# Altium schematic sheet RV1126_POWER_SHEET.SchDoc
size A4; SheetNumber: 9; SheetTotal: 25
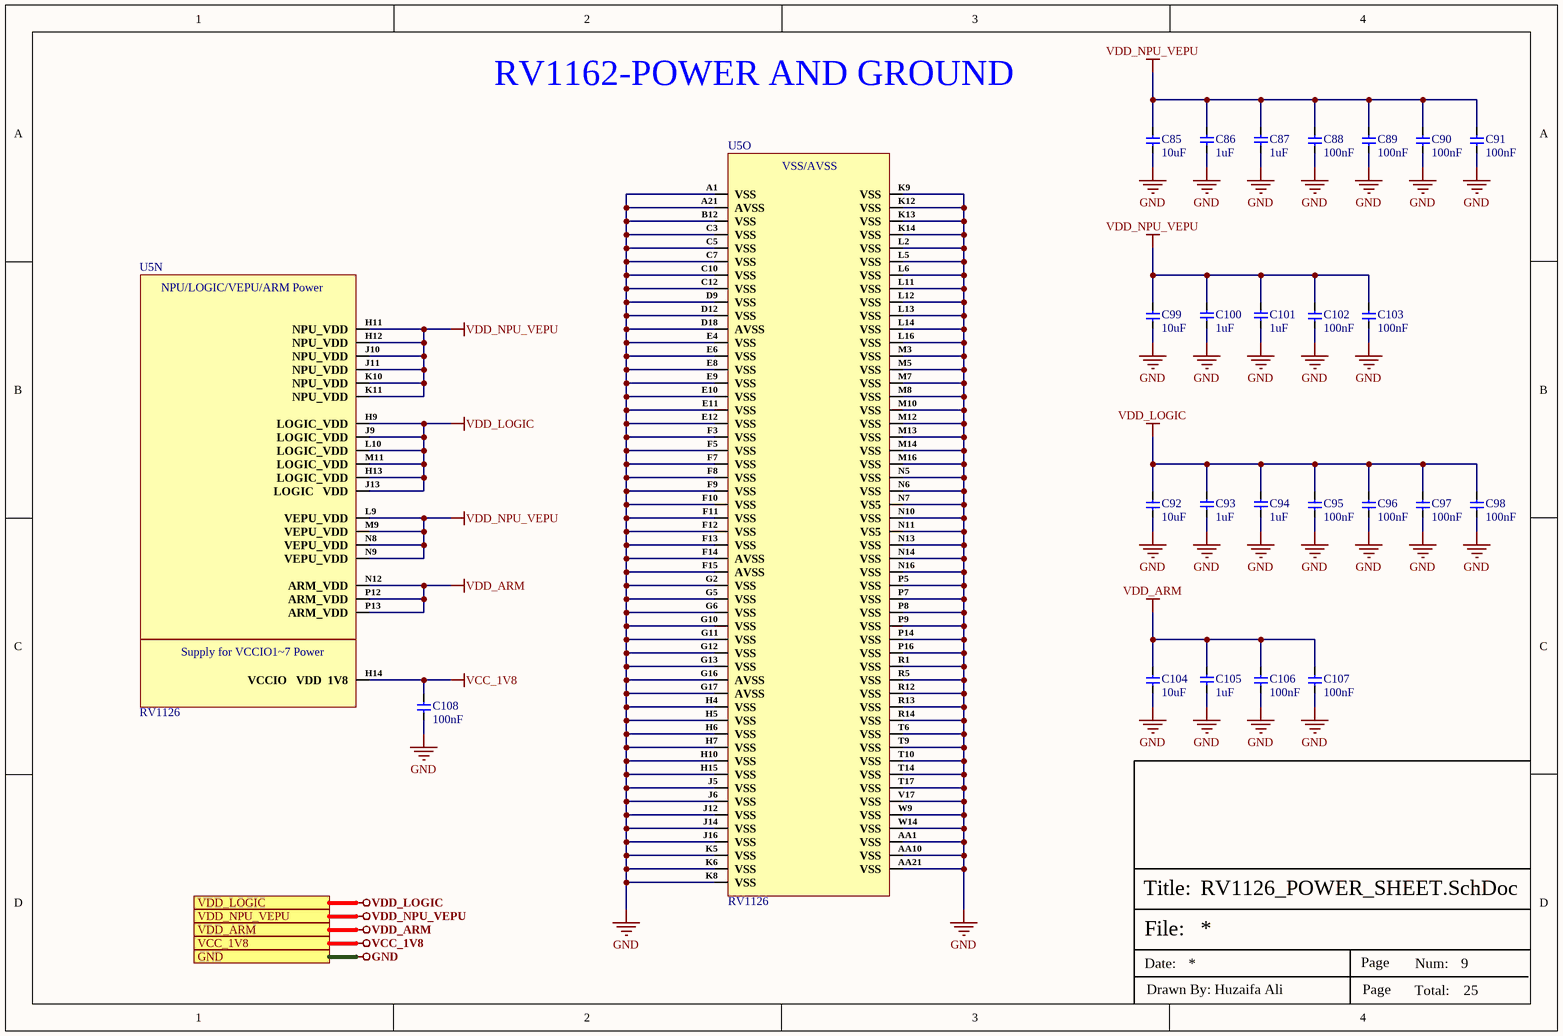
[diagram p0: RV1126_POWER_SHEET.SchDoc]

## Parts
C85  10uF  [Cap-0603]
C86  1uF  [Cap-0402]
C87  1uF  [Cap-0402]
C88  100nF  [CAP-0201]
C89  100nF  [CAP-0201]
C90  100nF  [CAP-0201]
C91  100nF  [CAP-0201]
C92  10uF  [Cap-0603]
C93  1uF  [Cap-0402]
C94  1uF  [Cap-0402]
C95  100nF  [CAP-0201]
C96  100nF  [CAP-0201]
C97  100nF  [CAP-0201]
C98  100nF  [CAP-0201]
C99  10uF  [Cap-0603]
C100  1uF  [Cap-0402]
C101  1uF  [Cap-0402]
C102  100nF  [CAP-0201]
C103  100nF  [CAP-0201]
C104  10uF  [Cap-0603]
C105  1uF  [Cap-0402]
C106  100nF  [CAP-0201]
C107  100nF  [CAP-0201]
C108  100nF  [CAP-0201]
U5  RV1126  [FCCSP-409(14x14)]  (parts N,O of 15)

## Ports
GND (see DDR3_SDRAM_INTERFACE[4D], DIGITAL_MEMS_MIC_INTERFACE[3D], eMMC_INTERFACE[3D], ETHERNET_SWITCH_INTERFACE[5C], IR-CUT_LIGHT SENSOR_SHEET[3D], MIPI TO HDMI_MODULE_INTERFACE[3D], MIPI-CSI_RXX_INTERFACE[4C], PoE PD INTERFACE[3D], PoE_PSE_CONTROLLER[5D], POWER_LDO_SHEET[3D], POWER_PMIC_RK809_CODEC[3D], POWER_PMIC_RK809_DC DC[3D], POWER_PMIC_RK809_LDO[4C], POWER_PMIC_RK809_MANAGEMENT[3D], RV1126_AUDIO_SHEET[3D], RV1126_DRAM_SHEET[4C], RV1126_eMMC_SPI-FLASH_SHEET[3D], RV1126_ETHERNET_SHEET[3D], RV1126_OSC-PLL-PMUIO[3C], RV1126_SARADC_SHEET[3C], SPI_FLASH_INTERFACE[3D], SYNCHRONOUS _BUCK_CONTROLLER[3D], USB2.0_DEBUG_UART[3D], WIFI_AP6256_SHEET[4D]), VCC_1V8, VDD_ARM (see POWER_PMIC_RK809_DC DC[3D]), VDD_LOGIC (see POWER_LDO_SHEET[3D]), VDD_NPU_VEPU (see POWER_PMIC_RK809_DC DC[3D])

## Nets
GND: C85.1 C86.2 C87.2 C88.1 C89.1 C90.1 C91.1 C92.1 C93.2 C94.2 C95.1 C96.1 C97.1 C98.1 C99.1 C100.2 C101.2 C102.1 C103.1 C104.1 C105.2 C106.1 C107.1 C108.1 U5.A1(VSS) U5.A21(AVSS) U5.AA1(VSS) U5.AA10(VSS) U5.AA21(VSS) U5.B12(VSS) U5.C3(VSS) U5.C5(VSS) U5.C7(VSS) U5.C10(VSS) U5.C12(VSS) U5.D9(VSS) U5.D12(VSS) U5.D18(AVSS) U5.E4(VSS) U5.E6(VSS) U5.E8(VSS) U5.E9(VSS) U5.E10(VSS) U5.E11(VSS) U5.E12(VSS) U5.F3(VSS) U5.F5(VSS) U5.F7(VSS) U5.F8(VSS) U5.F9(VSS) U5.F10(VSS) U5.F11(VSS) U5.F12(VSS) U5.F13(VSS) U5.F14(AVSS) U5.F15(AVSS) U5.G2(VSS) U5.G5(VSS) U5.G6(VSS) U5.G10(VSS) U5.G11(VSS) U5.G12(VSS) U5.G13(VSS) U5.G16(AVSS) U5.G17(AVSS) U5.H4(VSS) U5.H5(VSS) U5.H6(VSS) U5.H7(VSS) U5.H10(VSS) U5.H15(VSS) U5.J5(VSS) U5.J6(VSS) U5.J12(VSS) U5.J14(VSS) U5.J16(VSS) U5.K5(VSS) U5.K6(VSS) U5.K8(VSS) U5.K9(VSS) U5.K12(VSS) U5.K13(VSS) U5.K14(VSS) U5.L2(VSS) U5.L5(VSS) U5.L6(VSS) U5.L11(VSS) U5.L12(VSS) U5.L13(VSS) U5.L14(VSS) U5.L16(VSS) U5.M3(VSS) U5.M5(VSS) U5.M7(VSS) U5.M8(VSS) U5.M10(VSS) U5.M12(VSS) U5.M13(VSS) U5.M14(VSS) U5.M16(VSS) U5.N5(VSS) U5.N6(VSS) U5.N7(VS5) U5.N10(VSS) U5.N11(VS5) U5.N13(VSS) U5.N14(VSS) U5.N16(VSS) U5.P5(VSS) U5.P7(VSS) U5.P8(VSS) U5.P9(VSS) U5.P14(VSS) U5.P16(VSS) U5.R1(VSS) U5.R5(VSS) U5.R12(VSS) U5.R13(VSS) U5.R14(VSS) U5.T6(VSS) U5.T9(VSS) U5.T10(VSS) U5.T14(VSS) U5.T17(VSS) U5.V17(VSS) U5.W9(VSS) U5.W14(VSS) ; port GND
VCC_1V8: C108.2 U5.H14(VCCIO___VDD__1V8) ; port VCC_1V8
VDD_ARM: C104.2 C105.1 C106.2 C107.2 U5.N12(ARM_VDD) U5.P12(ARM_VDD) U5.P13(ARM_VDD) ; port VDD_ARM
VDD_LOGIC: C92.2 C93.1 C94.1 C95.2 C96.2 C97.2 C98.2 U5.H9(LOGIC_VDD) U5.H13(LOGIC_VDD) U5.J9(LOGIC_VDD) U5.J13(LOGIC___VDD) U5.L10(LOGIC_VDD) U5.M11(LOGIC_VDD) ; port VDD_LOGIC
VDD_NPU_VEPU: C85.2 C86.1 C87.1 C88.2 C89.2 C90.2 C91.2 C99.2 C100.1 C101.1 C102.2 C103.2 U5.H11(NPU_VDD) U5.H12(NPU_VDD) U5.J10(NPU_VDD) U5.J11(NPU_VDD) U5.K10(NPU_VDD) U5.K11(NPU_VDD) U5.L9(VEPU_VDD) U5.M9(VEPU_VDD) U5.N8(VEPU_VDD) U5.N9(VEPU_VDD) ; port VDD_NPU_VEPU

## Notes on the sheet
- RV1162-POWER AND GROUND
- File:
- Title:
- Date:
- Page
- Num:
- Total:
- Drawn By: Huzaifa Ali
- (in symbol RV1126, part N) NPU/LOGIC/VEPU/ARM Power; Supply for VCCIO1~7 Power
- (in symbol RV1126, part O) VSS/AVSS

## Library data of the parts
C85 C92 C99 C104 = CC0603KRX5R6BB106: CAP CER 10UF 10V X5R 0603; Manufacturer: Yageo; Tolerance: 10%; Item Type: Capacitor; Supplier 1: Digi-Key; Manufacturer Part Number: CC0603KRX5R6BB106; RoHS: Yes; Category: Ceramic Capacitors; Stock 1: 187515; Pricing 1: 1=0.24000, 10=0.16300, 50=0.09780, 100=0.08260, 500=0.05654, 1000=0.05001 (USD); Mount: Surface Mount; Case/Package: 0603; Case Code (Metric): 1608; Case Code (Imperial): 0603; Weight: 7.1E-05oz; Min Operating Temperature: -55°C; Max Operating Temperature: 85°C; Capacitance: 10uF; Packaging: Tape and Reel; Dielectric: X5R; Voltage Rating: 10V; Termination: SMD/SMT; Resistor Type: Ceramic; Voltage Rating (DC): 10V; Package Quantity: 4000; Length: 0.063inch; Width: 0.031inch; Thickness: 0.035inch; Depth: 0.8mm; Lead Free: Lead Free; Halogen Free: Halogen Free; RoHS Compliant: Yes; ComponentLink1URL: http://www.mouser.com/ds/2/447/Yageo_UPY-GP_NP0_16V-to-50V_9-358835.pdf?src-supplier=Mouser; ComponentLink1Description: http://www.mouser.com/ds/2/447/Yageo_UPY-GP_NP0_16V-to-50V_9-358835.pdf?src-supplier=Mouser; ComponentLink2URL: http://www.yageo.com/documents/recent/UPY-GPHC_X5R_4V-to-50V_25.pdf?src-supplier=Digi-Key; ComponentLink2Description: http://www.yageo.com/documents/recent/UPY-GPHC_X5R_4V-to-50V_25.pdf?src-supplier=Digi-Key; Supplier Part Number 1: 311-1782-1-ND; LCSC Part Number: C326057
C86 C87 C93 C94 C100 C101 C105 = CC0402KRX5R6BB105: CAP CER 1UF 10V X5R 0402; Manufacturer: Yageo; Tolerance: 10%; Dissipation Factor: 15%; Item Type: Capacitor; Supplier 1: Mouser; Manufacturer Part Number: CC0402KRX5R6BB105; RoHS: Yes; Category: Ceramic Capacitors; Stock 1: 6711367; Pricing 1: 1=0.11000, 10=0.05500, 50=0.05500, 100=0.03300, 500=0.02700, 1000=0.02200, 2500=0.02100, 10000=0.01800 (USD); Mount: Surface Mount; Case/Package: 0402; Number of Pins: 2; Case Code (Metric): 1005; Case Code (Imperial): 0402; Min Operating Temperature: -55°C; Max Operating Temperature: 85°C; Capacitance: 1uF; Dielectric: X5R; Package Quantity: 1; Voltage Rating: 10V; Packaging: Tape and Reel; Voltage Rating (DC): 10V; Termination: SMD/SMT; Resistor Type: Ceramic; Series: CC; Construction: Flat; Length: 1mm; Width: 0.02inch; Height: 0.5mm; Thickness: 0.022inch; Depth: 0.5mm; Radiation Hardening: No; REACH SVHC: No SVHC; Lead Free: Lead Free; Halogen Free: Halogen Free; RoHS Compliant: Yes; ComponentLink1URL: https://datasheet.ciiva.com/176/upy-gphc-x5r-4v-to-50v-12-176704.pdf?src-supplier=Digi-Key; ComponentLink1Description: https://datasheet.ciiva.com/176/upy-gphc-x5r-4v-to-50v-12-176704.pdf?src-supplier=Digi-Key; ComponentLink2URL: https://datasheet.ciiva.com/176/mlccorderingcode-176705.pdf?src-supplier=Digi-Key; ComponentLink2Description: https://datasheet.ciiva.com/176/mlccorderingcode-176705.pdf?src-supplier=Digi-Key; ComponentLink3URL: https://datasheet.ciiva.com/176/mlccorderingcode-176706.pdf?src-supplier=Digi-Key; ComponentLink3Description: https://datasheet.ciiva.com/176/mlccorderingcode-176706.pdf?src-supplier=Digi-Key; Supplier Part Number 1: 603-CC402KRX5R6BB105; LCSC Part Number: C106254
C88-C91 C95-C98 C102 C103 C106-C108 = CC0201KRX5R6BB104: CAP CER 0.1UF 10V X5R 0201; Manufacturer: Yageo; Tolerance: 10%; Supplier 1: Mouser; Manufacturer Part Number: CC0201KRX5R6BB104; RoHS: Yes; Category: Ceramic Capacitors; Stock 1: 824403; Pricing 1: 1=0.10000, 10=0.02400, 50=0.02400, 100=0.01900, 1000=0.01100, 10000=0.00900 (USD); Mount: Surface Mount; Case/Package: 0201; Case Code (Imperial): 0201; Case Code (Metric): 0603; Weight: 6E-06oz; Min Operating Temperature: -55°C; Max Operating Temperature: 85°C; Capacitance: 100nF; Dielectric: X5R; Voltage Rating (DC): 10V; Packaging: Tape and Reel; Termination: SMD/SMT; Resistor Type: Ceramic; Voltage Rating: 10V; Series: CC; Construction: Flat; Length: 0.6mm; Width: 0.012inch; Height: 0.3mm; Thickness: 0.013inch; Depth: 0.3mm; Radiation Hardening: No; Lead Free: Lead Free; Halogen Free: Halogen Free; RoHS Compliant: Yes; ComponentLink1URL: https://datasheet.ciiva.com/11587/upy-gphc-x5r-4v-to-50v-12-11587190.pdf?src-supplier=Avnet; ComponentLink1Description: https://datasheet.ciiva.com/11587/upy-gphc-x5r-4v-to-50v-12-11587190.pdf?src-supplier=Avnet; Supplier Part Number 1: 603-CC201KRX5R6BB104; LCSC Part Number: C190183
U5 = RV1126: FCCSP-409(14x14) Microcontroller Units (MCUs/MPUs/SOCs) ROHS; Manufacturer: Rockchip; Manufacturer Part Number: RV1126; Package: FCCSP-409(14x14); LCSC Part Number: C2859017; Item Type: Microcontroller; ComponentLink1Description: LCSC; ComponentLink1URL: https://www.lcsc.com/product-detail/Microcontroller-Units-MCUs-MPUs-SOCs_Rockchip-RV1126_C2859017.html